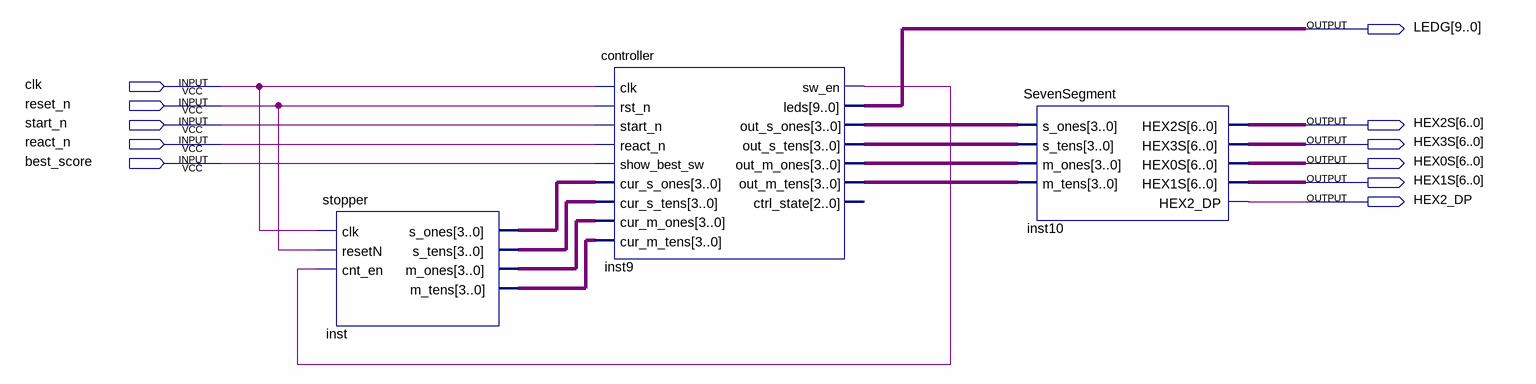
[diagram p0: schematic sheet]
// Quartus schematic Block3.bdf as structural Verilog: 3 symbols, 11 pins
module Block3 (
  input  clk,
  input  reset_n,
  input  start_n,
  input  react_n,
  input  best_score,
  output [9:0] LEDG,
  output [6:0] HEX2S,
  output [6:0] HEX3S,
  output [6:0] HEX0S,
  output [6:0] HEX1S,
  output HEX2_DP
);

  wire inst9_sw_en;
  wire [3:0] inst9_out_m_ones, inst9_out_m_tens, inst9_out_s_ones, inst9_out_s_tens, inst_m_ones,
       inst_m_tens, inst_s_ones, inst_s_tens;

  stopper inst (
    .clk(clk), .resetN(reset_n), .cnt_en(inst9_sw_en), .s_ones(inst_s_ones), .s_tens(inst_s_tens),
    .m_ones(inst_m_ones), .m_tens(inst_m_tens));
  controller inst9 (
    .clk(clk), .rst_n(reset_n), .start_n(start_n), .react_n(react_n), .show_best_sw(best_score),
    .cur_s_ones(inst_s_ones), .cur_s_tens(inst_s_tens), .cur_m_ones(inst_m_ones), .cur_m_tens(inst_m_tens),
    .sw_en(inst9_sw_en), .leds(LEDG), .out_s_ones(inst9_out_s_ones), .out_s_tens(inst9_out_s_tens),
    .out_m_ones(inst9_out_m_ones), .out_m_tens(inst9_out_m_tens));  // open: ctrl_state
  SevenSegment inst10 (
    .s_ones(inst9_out_s_ones), .s_tens(inst9_out_s_tens), .m_ones(inst9_out_m_ones),
    .m_tens(inst9_out_m_tens), .HEX2S(HEX2S), .HEX3S(HEX3S), .HEX0S(HEX0S), .HEX1S(HEX1S), .HEX2_DP(HEX2_DP));
endmodule
